# Altium schematic sheet CAN-Sheet.SchDoc
size 420 x 297 mm; SheetNumber: 10; SheetTotal: 15
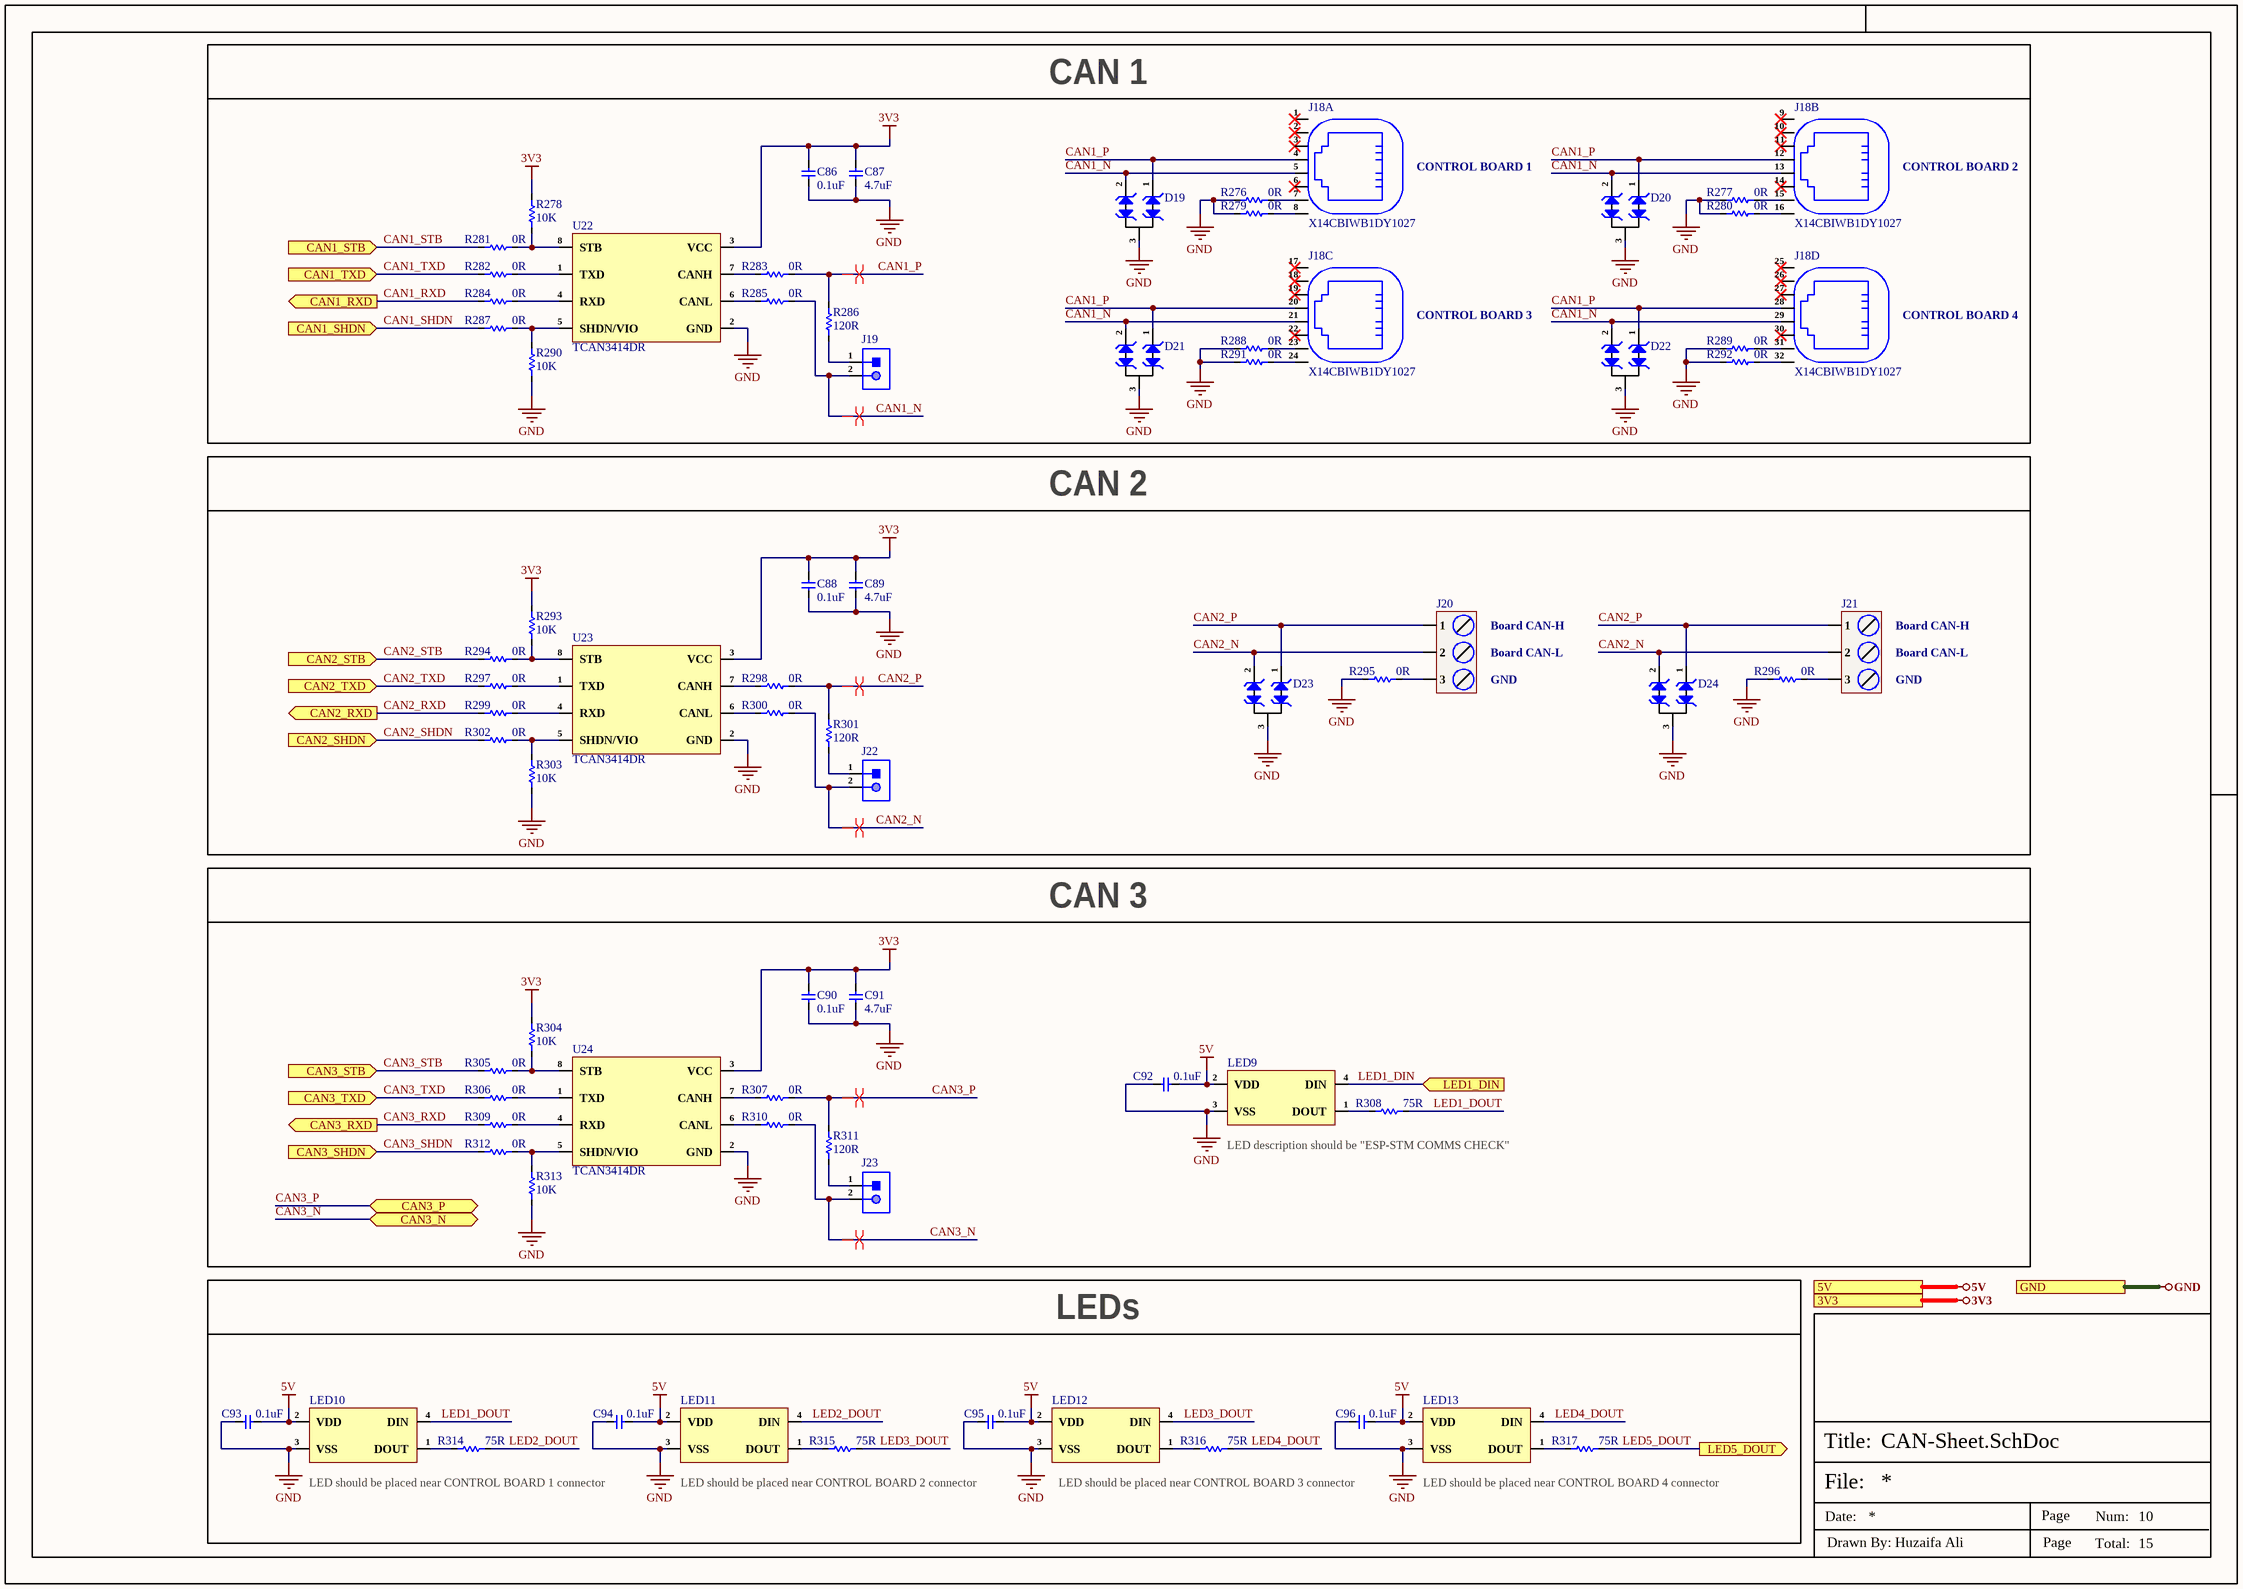
[diagram p0: CAN-Sheet.SchDoc]

## Parts
C86  0.1uF  [Cap-0402]
C87  4.7uF  [Cap-0402]
C88  0.1uF  [Cap-0402]
C89  4.7uF  [Cap-0402]
C90  0.1uF  [Cap-0402]
C91  4.7uF  [Cap-0402]
C92  0.1uF  [Cap-0402]
C93  0.1uF  [Cap-0402]
C94  0.1uF  [Cap-0402]
C95  0.1uF  [Cap-0402]
C96  0.1uF  [Cap-0402]
D19  CDSOT23-T24CAN-Q  [SOT-23]  (value not drawn)
D20  CDSOT23-T24CAN-Q  [SOT-23]  (value not drawn)
D21  CDSOT23-T24CAN-Q  [SOT-23]  (value not drawn)
D22  CDSOT23-T24CAN-Q  [SOT-23]  (value not drawn)
D23  CDSOT23-T24CAN-Q  [SOT-23]  (value not drawn)
D24  CDSOT23-T24CAN-Q  [SOT-23]  (value not drawn)
J18  X14CBIWB1DY1027  [X14CBIWB1DY1027]  (parts A,B,C,D of 4)
J19  X6511WV-02H-C60D30  [HDR1X2_]  (value not drawn)
J20  DB128L-5.08-3P-BK-S  [DB128L-5.08-3P-BK-S]  (value not drawn)
J21  DB128L-5.08-3P-BK-S  [DB128L-5.08-3P-BK-S]  (value not drawn)
J22  X6511WV-02H-C60D30  [HDR1X2_]  (value not drawn)
J23  X6511WV-02H-C60D30  [HDR1X2_]  (value not drawn)
LED9  WS2812D-F5  [WS2812D-F5]  (value not drawn)
LED10  WS2812D-F5  [WS2812D-F5]  (value not drawn)
LED11  WS2812D-F5  [WS2812D-F5]  (value not drawn)
LED12  WS2812D-F5  [WS2812D-F5]  (value not drawn)
LED13  WS2812D-F5  [WS2812D-F5]  (value not drawn)
R276  0R  [Res-0402]
R277  0R  [Res-0402]
R278  10K  [Res-0402]
R279  0R  [Res-0402]
R280  0R  [Res-0402]
R281  0R  [Res-0402]
R282  0R  [Res-0402]
R283  0R  [Res-0402]
R284  0R  [Res-0402]
R285  0R  [Res-0402]
R286  120R  [Res-0603]
R287  0R  [Res-0402]
R288  0R  [Res-0402]
R289  0R  [Res-0402]
R290  10K  [Res-0402]
R291  0R  [Res-0402]
R292  0R  [Res-0402]
R293  10K  [Res-0402]
R294  0R  [Res-0402]
R295  0R  [Res-0402]
R296  0R  [Res-0402]
R297  0R  [Res-0402]
R298  0R  [Res-0402]
R299  0R  [Res-0402]
R300  0R  [Res-0402]
R301  120R  [Res-0603]
R302  0R  [Res-0402]
R303  10K  [Res-0402]
R304  10K  [Res-0402]
R305  0R  [Res-0402]
R306  0R  [Res-0402]
R307  0R  [Res-0402]
R308  75R  [Res-0402]
R309  0R  [Res-0402]
R310  0R  [Res-0402]
R311  120R  [Res-0603]
R312  0R  [Res-0402]
R313  10K  [Res-0402]
R314  75R  [Res-0402]
R315  75R  [Res-0402]
R316  75R  [Res-0402]
R317  75R  [Res-0402]
U22  TCAN3414DR  [SOIC-8(0.154", 3.90mm Width)]
U23  TCAN3414DR  [SOIC-8(0.154", 3.90mm Width)]
U24  TCAN3414DR  [SOIC-8(0.154", 3.90mm Width)]

## Blocks framed on the sheet
CAN 1: C86 C87 D19-D22 J18 J19 R276-R292 U22
CAN 2: C88 C89 D23 D24 J20-J22 R293-R303 U23
CAN 3: C90-C92 J23 LED9 R304-R313 U24
LEDs: C93-C96 LED10-LED13 R314-R317

## Ports
3V3 (see Top-Sheet[2C], Controller-Sheet-1[4D], Controller-Sheet-2[4D], Controller-Sheet-3[4D], DIOs-Lights-Sensors-Sheet[4D], Display-Sheet[5D], ESP32_Sheet[6D], EtherCAT-Sheet[1D], Ethernet-Sheet[5D], Power-Sheet[4D], RS232-Sheet[5D], RS485-Sheet[5D], STM32-USB-Sheet[4D]), 5V (see Top-Sheet[2C], Analog-AIO-Sheet[5D], Controller-Sheet-2[4D], Controller-Sheet-3[4D], DIOs-Lights-Sensors-Sheet[4D], Display-Sheet[5D], Power-Sheet[4D], RS232-Sheet[5D], RS485-Sheet[5D], STM32-USB-Sheet[4D]), CAN1_RXD (out, see Top-Sheet[2C]), CAN1_SHDN (in, see Top-Sheet[2C]), CAN1_STB (in, see Top-Sheet[2C]), CAN1_TXD (in, see Top-Sheet[2C]), CAN2_RXD (out, see Top-Sheet[2D]), CAN2_SHDN (in, see Top-Sheet[2C]), CAN2_STB (in, see Top-Sheet[2D]), CAN2_TXD (in, see Top-Sheet[2D]), CAN3_N (bidir, see Top-Sheet[2C]), CAN3_P (bidir, see Top-Sheet[2C]), CAN3_RXD (out, see Top-Sheet[2D]), CAN3_SHDN (in, see Top-Sheet[2D]), CAN3_STB (in, see Top-Sheet[2D]), CAN3_TXD (in, see Top-Sheet[2D]), GND (see Top-Sheet[2C], Analog-AIO-Sheet[5D], Controller-Sheet-1[4D], Controller-Sheet-2[4D], Controller-Sheet-3[4D], DIOs-Lights-Sensors-Sheet[4D], Display-Sheet[5D], ESP32_Sheet[6D], EtherCAT-Sheet[1D], Ethernet-Sheet[5D], Power-Sheet[4D], RS232-Sheet[5D], RS485-Sheet[5D], STM32-USB-Sheet[4D]), LED1_DIN (in, see Top-Sheet[2D]), LED5_DOUT (out, see Top-Sheet[2D], RS232-Sheet[5B])

## Nets
3V3: C86.2 C87.2 C88.2 C89.2 C90.2 C91.2 R278.2 R293.2 R304.2 U22.3(VCC) U23.3(VCC) U24.3(VCC) ; port 3V3
5V: C92.2 C93.2 C94.2 C95.2 C96.2 LED9.2(VDD) LED10.2(VDD) LED11.2(VDD) LED12.2(VDD) LED13.2(VDD) ; port 5V
GND: C86.1 C87.1 C88.1 C89.1 C90.1 C91.1 C92.1 C93.1 C94.1 C95.1 C96.1 D19.3 D20.3 D21.3 D22.3 D23.3 D24.3 LED9.3(VSS) LED10.3(VSS) LED11.3(VSS) LED12.3(VSS) LED13.3(VSS) R276.1 R277.1 R279.1 R280.1 R288.1 R289.1 R290.1 R291.1 R292.1 R295.1 R296.1 R303.1 R313.1 U22.2(GND) U23.2(GND) U24.2(GND) ; port GND
CAN1_N: D19.2 D20.2 D21.2 D22.2 J18.5 J18.13 J18.21 J18.29 J19.2 R285.2
CAN1_P: D19.1 D20.1 D21.1 D22.1 J18.4 J18.12 J18.20 J18.28 R283.2 R286.2
CAN1_RXD: R284.1 ; port CAN1_RXD
CAN1_SHDN: R287.1 ; port CAN1_SHDN
CAN1_STB: R281.1 ; port CAN1_STB
CAN1_TXD: R282.1 ; port CAN1_TXD
CAN2_N: D23.2 D24.2 J20.2 J21.2 J22.2 R300.2
CAN2_P: D23.1 D24.1 J20.1 J21.1 R298.2 R301.2
CAN2_RXD: R299.1 ; port CAN2_RXD
CAN2_SHDN: R302.1 ; port CAN2_SHDN
CAN2_STB: R294.1 ; port CAN2_STB
CAN2_TXD: R297.1 ; port CAN2_TXD
CAN3_N: J23.2 R310.2 ; port CAN3_N
CAN3_P: R307.2 R311.2 ; port CAN3_P
CAN3_RXD: R309.1 ; port CAN3_RXD
CAN3_SHDN: R312.1 ; port CAN3_SHDN
CAN3_STB: R305.1 ; port CAN3_STB
CAN3_TXD: R306.1 ; port CAN3_TXD
LED1_DIN: LED9.4(DIN) ; port LED1_DIN
LED1_DOUT: LED10.4(DIN) R308.2
LED2_DOUT: LED11.4(DIN) R314.2
LED3_DOUT: LED12.4(DIN) R315.2
LED4_DOUT: LED13.4(DIN) R316.2
LED5_DOUT: R317.2 ; port LED5_DOUT
NetJ18_7: J18.7 R276.2
NetJ18_8: J18.8 R279.2
NetJ18_15: J18.15 R277.2
NetJ18_16: J18.16 R280.2
NetJ18_23: J18.23 R288.2
NetJ18_24: J18.24 R291.2
NetJ18_31: J18.31 R289.2
NetJ18_32: J18.32 R292.2
NetJ19_1: J19.1 R286.1
NetJ20_3: J20.3 R295.2
NetJ21_3: J21.3 R296.2
NetJ22_1: J22.1 R301.1
NetJ23_1: J23.1 R311.1
NetLED9_1: LED9.1(DOUT) R308.1
NetLED10_1: LED10.1(DOUT) R314.1
NetLED11_1: LED11.1(DOUT) R315.1
NetLED12_1: LED12.1(DOUT) R316.1
NetLED13_1: LED13.1(DOUT) R317.1
NetR278_1: R278.1 R281.2 U22.8(STB)
NetR282_2: R282.2 U22.1(TXD)
NetR283_1: R283.1 U22.7(CANH)
NetR284_2: R284.2 U22.4(RXD)
NetR285_1: R285.1 U22.6(CANL)
NetR287_2: R287.2 R290.2 U22.5(SHDN/VIO)
NetR293_1: R293.1 R294.2 U23.8(STB)
NetR297_2: R297.2 U23.1(TXD)
NetR298_1: R298.1 U23.7(CANH)
NetR299_2: R299.2 U23.4(RXD)
NetR300_1: R300.1 U23.6(CANL)
NetR302_2: R302.2 R303.2 U23.5(SHDN/VIO)
NetR304_1: R304.1 R305.2 U24.8(STB)
NetR306_2: R306.2 U24.1(TXD)
NetR307_1: R307.1 U24.7(CANH)
NetR309_2: R309.2 U24.4(RXD)
NetR310_1: R310.1 U24.6(CANL)
NetR312_2: R312.2 R313.2 U24.5(SHDN/VIO)

Not connected (* = marked no-connect by the designer): J18 1* 2* 3* 6* 9* 10* 11* 14* 17* 18* 19* 22* 25* 26* 27* 30*

## Layout directives
differential pair; differential pair class CAN: CAN1_N, CAN1_P, CAN2_N, CAN2_P, CAN3_N, CAN3_P

## Notes on the sheet
- CONTROL BOARD 1
- CONTROL BOARD 2
- CONTROL BOARD 3
- CONTROL BOARD 4
- Board CAN-H
- Board CAN-L
- GND
- LED description should be "ESP-STM COMMS CHECK"
- LED should be placed near CONTROL BOARD 1 connector
- LED should be placed near CONTROL BOARD 2 connector
- LED should be placed near CONTROL BOARD 3 connector
- LED should be placed near CONTROL BOARD 4 connector
- File:
- Title:
- Date:
- Page
- Num:
- Total:
- Drawn By: Huzaifa Ali

## Library data of the parts
C86 C88 C90 C92-C96 = CC0402JRX7R7BB104: CAP CER 0.1UF 16V X7R 0402; Manufacturer: Yageo; Material: 4241ConductorMaterial; Value: 100nF; Tolerance: 5%; Item Type: Capacitor; Supplier: Digikey; Supplier Part Number: 311-1676-1-ND; Manufacturer Part Number: CC0402JRX7R7BB104; RoHS: Yes; Category: Ceramic Capacitors; Stock: 1659111; Pricing: 1=0.1, 10=0.046, 50=0.0262, 100=0.0203, 500=0.01528, 1000=0.012, 2500=0.01091, 5000=0.01004 (USD); Mounting Technology: Surface Mount; Case/Package: 0402; Case Code (Metric): 1005; Case Code (Imperial): 0402; Min Operating Temperature: -55°C; Max Operating Temperature: 125°C; Dielectric: X7R; Packaging: Tape and Reel; Package Quantity: 10000; Voltage Rating (DC): 16V; Voltage Rating: 16V; Series: CC; Construction: Flat; Length: 0.039inch; Width: 0.02inch; Height: 0.5mm; Thickness: 0.022inch; Lead Free: Lead Free; Halogen Free: Halogen Free; RoHS Compliant: Yes; ComponentLink1URL: https://datasheet.ciiva.com/13210/upy-gphc-x7r-6-3v-to-50v-8-12304-13210152.pdf?src-supplier=Mouser; ComponentLink1Description: https://datasheet.ciiva.com/13210/upy-gphc-x7r-6-3v-to-50v-8-12304-13210152.pdf?src-supplier=Mouser; LCSC Part Number: C541464
C87 C89 C91 = CC0402KRX5R6BB475: CAP CER 4.7UF 10V X5R 0402; Manufacturer: Yageo; Tolerance: 10%; Supplier 1: Farnell; Manufacturer Part Number: CC0402KRX5R6BB475; RoHS: Yes; Category: Ceramic Capacitors; Stock 1: 20000; Pricing 1: 10000=0.02310, 50000=0.02100 (GBP); Mount: Surface Mount; Case/Package: 0402; Case Code (Imperial): 0402; Case Code (Metric): 1005; Min Operating Temperature: -55°C; Max Operating Temperature: 85°C; Packaging: Cut Tape; Capacitance: 4.7uF; Voltage Rating: 10V; RoHS Compliant: Yes; ComponentLink1URL: http://www.yageo.com/documents/recent/UPY-GPHC_X5R_4V-to-50V_25.pdf?src-supplier=Digi-Key; ComponentLink1Description: http://www.yageo.com/documents/recent/UPY-GPHC_X5R_4V-to-50V_25.pdf?src-supplier=Digi-Key; Supplier Part Number 1: 3871698; LCSC Part Number: C326586
D19-D24 = CDSOT23-T24CAN-Q: TVS DIODE 24VWM 40VC SOT23-3; Manufacturer: Bourns; Item Type: TVS Diodes; Supplier: Digikey; LCSC Part Number: C350941; Manufacturer Part Number: CDSOT23-T24CAN-Q; RoHS: Yes; Stock: 17231; Pricing: 1=0.36, 10=0.282, 100=0.1691, 500=0.15656, 1000=0.10645, 3000=0.098, 6000=0.09393, 9000=0.08454, 30000=0.08328, 75000=0.07827 (USD); RoHS Compliant: 5897YesNo; ComponentLink1URL: http://www.farnell.com/datasheets/2372435.pdf?src-supplier=Farnell; ComponentLink1Description: http://www.farnell.com/datasheets/2372435.pdf?src-supplier=Farnell; ComponentLink2URL: https://www.bourns.com/docs/Product-Datasheets/cdsot23-t24can-Q.pdf?src-supplier=Digikey; ComponentLink2Description: https://www.bourns.com/docs/Product-Datasheets/cdsot23-t24can-Q.pdf?src-supplier=Digikey; ComponentLink3URL: http://www.farnell.com/datasheets/2372435.pdf?src-supplier=Newark; ComponentLink3Description: http://www.farnell.com/datasheets/2372435.pdf?src-supplier=Newark
J18 = X14CBIWB1DY1027: RJ45Receptacle 4 Unshielded Bend-in Gold Phosphor Bronze Without LED -40℃~+85℃ Plugin Ethernet Connectors / Modular Connectors (RJ45 RJ11) ROHS; Manufacturer: XKB Connection; Manufacturer Part Number: X14CBIWB1DY1027; Package: Plugin; LCSC Part Number: C2931489; Item Type: Connectors (RJ45 RJ11); ComponentLink1Description: LCSC; ComponentLink1URL: https://www.lcsc.com/product-detail/Ethernet-Connectors-Modular-Connectors-RJ45-RJ11_XKB-Connection-X14CBIWB1DY1027_C2931489.html
J19 J22 J23 = X6511WV-02H-C60D30: Gold 250V 3A Straight Square Pins 2.5mm 2P 260℃ 6mm -40℃~+105℃ 3mm 2.54mm Plugin Black Brass 1x2P Plugin,P=2.54mm Pin Headers ROHS; Manufacturer: XKB; Item Type: Male Header; Manufacturer Part Number: X6511WV-02H-C60D30; Package: Plugin,P=2.54mm; LCSC Part Number: C706874; ComponentLink1Description: LCSC; ComponentLink1URL: https://www.lcsc.com/product-detail/Pin-Headers_XKB-Connectivity-X6511WV-02H-C60D30_C706874.html
J20 J21 = DB128L-5.08-3P-BK-S: 1x3P 18A -40℃~+105℃ 250V Black 12~30 Straight pin 5.08mm 2.5 1 3 Plugin,P=5.08mm Screw terminal ROHS; Manufacturer: DIBO; Item Type: Terminal Block; Manufacturer Part Number: DB128L-5.08-3P-BK-S; Package: Plugin,P=5.08mm; LCSC Part Number: C430602; ComponentLink1Description: LCSC; ComponentLink1URL: https://www.lcsc.com/product-detail/Screw-terminal_DIBO-DB128L-5-08-3P-BK-S_C430602.html
LED9-LED13 = WS2812D-F5: Plugin,D=5mm RGB LEDs ROHS; Manufacturer: Worldsemi; Item Type: RGB LED; Manufacturer Part Number: WS2812D-F5; Package: Plugin,D=5mm; LCSC Part Number: C190565; ComponentLink1Description: LCSC; ComponentLink1URL: https://jlcpcb.com/partdetail/Worldsemi-WS2812DF5/C190565
R276 R277 R279-R285 R287-R289 R291 R292 R294-R300 R302 R305-R307 R309 R310 R312 = RC0402FR-070RL: RES 0 OHM JUMPER 1/16W 0402; Manufacturer: Yageo; Item Type: Resistors; Tolerance: 1%; Power Rating: 62.5mW; Voltage Rating: 50V; Temperature Coefficient: 200ppm/°C; Max Power Dissipation: 63mW; Supplier 1: Mouser; Manufacturer Part Number: RC0402FR-070RL; RoHS: Yes; Stock 1: 8556842; Pricing 1: 1=0.10000, 10=0.01400, 50=0.01400, 100=0.00600, 1000=0.00300, 5000=0.00200, 10000=0.00100 (USD); Mount: Surface Mount; Case/Package: 0402; Contact Plating: Tin,Matte; Case Code (Imperial): 0402; Case Code (Metric): 1005; Size Code: 0402; Min Operating Temperature: -55°C; Max Operating Temperature: 155°C; Resistance: 0R; Resistor Type: Thick Film; Packaging: Tape and Reel; Termination: SMD/SMT; Features: Moisture Resistant; Series: RC; Number of Terminations: 2; Length: 1mm; Width: 0.5mm; Height: 0.35mm; Radiation Hardening: No; Lead Free: Lead Free; RoHS Compliant: Yes; ComponentLink1URL: https://datasheet.ciiva.com/8896/pyu-rc0402-51-rohs-l-6-8896149.pdf?src-supplier=Avnet; ComponentLink1Description: https://datasheet.ciiva.com/8896/pyu-rc0402-51-rohs-l-6-8896149.pdf?src-supplier=Avnet; ComponentLink2URL: https://datasheet.ciiva.com/16790/pyu-rc0402-51-rohs-l-6-r-16790444.pdf?src-supplier=Future+Electronics; ComponentLink2Description: https://datasheet.ciiva.com/16790/pyu-rc0402-51-rohs-l-6-r-16790444.pdf?src-supplier=Future+Electronics; Supplier Part Number 1: 603-RC0402FR-070RL; LCSC Part Number: C106231
R278 R290 R293 R303 R304 R313 = RC0402FR-0710KL: RES 10K OHM 1% 1/16W 0402; Manufacturer: Yageo; Resistance: 10kR; Voltage Rating (DC): 50V; Temperature Coefficient: 100ppm/°C; Power Rating: 62.5mW; Max Power Dissipation: 63mW; Item Type: Resistor; Supplier 1: Mouser; Manufacturer Part Number: RC0402FR-0710KL; RoHS: Yes; Category: Chip SMD Resistors; Stock 1: 18648329; Pricing 1: 1=0.10000, 10=0.01400, 50=0.01400, 100=0.00500, 1000=0.00300, 10000=0.00200 (USD); Case/Package: 0402; Number of Pins: 2; Case Code (Imperial): 0402; Case Code (Metric): 1005; Min Operating Temperature: -55°C; Max Operating Temperature: 155°C; Resistor Type: Thick Film; Tolerance: 1%; Packaging: Tape and Reel; Voltage Rating: 50V; Termination: SMD/SMT; Working Voltage: 50V; Number of Terminations: 2; Features: Moisture Resistant; Series: RC; Resistance Tolerance: 1%; Construction: Rectangular; Length: 1mm; Width: 0.5mm; Height: 0.32mm; Depth: 0.5mm; Lead Pitch: 0.2mm; REACH SVHC: No SVHC; Lead Free: Lead Free; RoHS Compliant: Yes; Military Standard: Not; ComponentLink1URL: https://datasheet.ciiva.com/7660/38568-7660787.pdf?src-supplier=Element14; ComponentLink1Description: https://datasheet.ciiva.com/7660/38568-7660787.pdf?src-supplier=Element14; ComponentLink2URL: https://datasheet.ciiva.com/7849/1686128-7849814.pdf?src-supplier=Element14; ComponentLink2Description: https://datasheet.ciiva.com/7849/1686128-7849814.pdf?src-supplier=Element14; ComponentLink3URL: https://datasheet.ciiva.com/7983/1018594-7983486.pdf?src-supplier=Element14; ComponentLink3Description: https://datasheet.ciiva.com/7983/1018594-7983486.pdf?src-supplier=Element14; ComponentLink4URL: https://datasheet.ciiva.com/22747/1018594-22747512.pdf?src-supplier=Element14; ComponentLink4Description: https://datasheet.ciiva.com/22747/1018594-22747512.pdf?src-supplier=Element14; ComponentLink5URL: https://datasheet.ciiva.com/12667/pyu-rc0402-51-rohs-l-6-r-12667067.pdf?src-supplier=Mouser; ComponentLink5Description: https://datasheet.ciiva.com/12667/pyu-rc0402-51-rohs-l-6-r-12667067.pdf?src-supplier=Mouser; ComponentLink6URL: https://datasheet.ciiva.com/7849/1784430-7849813.pdf?src-supplier=Element14; ComponentLink6Description: https://datasheet.ciiva.com/7849/1784430-7849813.pdf?src-supplier=Element14; ComponentLink7URL: https://datasheet.ciiva.com/7849/1784430-7849815.pdf?src-supplier=Element14; ComponentLink7Description: https://datasheet.ciiva.com/7849/1784430-7849815.pdf?src-supplier=Element14; Supplier Part Number 1: 603-RC0402FR-0710KL; LCSC Part Number: C60490
R286 R301 R311 = RC0603FR-07120RL: RES 120 OHM 1% 1/10W 0603; Manufacturer: Yageo; Temperature Coefficient: 100ppm/°C; Voltage Rating (DC): 50V; Power Rating: 100mW; Item Type: Resistor; Supplier 1: Digi-Key; Manufacturer Part Number: RC0603FR-07120RL; RoHS: Yes; Category: Chip SMD Resistors; Stock 1: 839061; Pricing 1: 1=0.10000, 10=0.02400, 100=0.00970, 1000=0.00436, 2500=0.00378 (USD); Case/Package: 0603; Number of Pins: 2; Case Code (Metric): 1608; Case Code (Imperial): 0603; Size Code: 0603; Min Operating Temperature: -55°C; Max Operating Temperature: 155°C; Resistance: 120R; Tolerance: 1%; Resistor Type: Thick Film; Packaging: Tape and Reel; Voltage Rating: 50V; Package Quantity: 1; Number of Terminations: 2; Termination: SMD/SMT; Max Power Dissipation: 100mW; Features: Moisture Resistant; Series: RC; Construction: Rectangular; Resistance Tolerance: 1%; Length: 1.6mm; Width: 0.031inch; Height: 0.022inch; Depth: 0.8mm; REACH SVHC: No SVHC; Lead Free: Lead Free; Military Standard: Not; RoHS Compliant: Yes; ComponentLink1URL: https://datasheet.ciiva.com/2553/pyu-r-int-thick-7-2553512.pdf?src-supplier=Digi-Key; ComponentLink1Description: https://datasheet.ciiva.com/2553/pyu-r-int-thick-7-2553512.pdf?src-supplier=Digi-Key; ComponentLink2URL: https://datasheet.ciiva.com/7746/443971-7746248.pdf?src-supplier=Element14; ComponentLink2Description: https://datasheet.ciiva.com/7746/443971-7746248.pdf?src-supplier=Element14; ComponentLink3URL: https://datasheet.ciiva.com/2553/pyu-r-int-thick-7-2553513.pdf?src-supplier=Digi-Key; ComponentLink3Description: https://datasheet.ciiva.com/2553/pyu-r-int-thick-7-2553513.pdf?src-supplier=Digi-Key; ComponentLink4URL: https://datasheet.ciiva.com/7746/443971-7746249.pdf?src-supplier=Element14; ComponentLink4Description: https://datasheet.ciiva.com/7746/443971-7746249.pdf?src-supplier=Element14; ComponentLink5URL: https://datasheet.ciiva.com/2553/pyu-r-int-thick-7-2553514.pdf?src-supplier=Digi-Key; ComponentLink5Description: https://datasheet.ciiva.com/2553/pyu-r-int-thick-7-2553514.pdf?src-supplier=Digi-Key; ComponentLink6URL: https://datasheet.ciiva.com/46395/443971-46395021.pdf?src-supplier=Element14; ComponentLink6Description: https://datasheet.ciiva.com/46395/443971-46395021.pdf?src-supplier=Element14; Supplier Part Number 1: 311-120HRCT-ND; LCSC Part Number: C114640
R308 R314-R317 = RC0402JR-0775RL: RES 75 OHM 5% 1/16W 0402; Manufacturer: Yageo; Item Type: Resistor; Temperature Coefficient: 100ppm/°C; Power Rating: 62.5mW; Voltage Rating: 50V; Max Power Dissipation: 63mW; Supplier: Digikey; Supplier Part Number: 311-75JRCT-ND; Manufacturer Part Number: RC0402JR-0775RL; RoHS: Yes; Stock: 2993323; Pricing: 1=0.1, 10=0.018, 50=0.0102, 100=0.0083, 500=0.00528, 1000=0.00444, 5000=0.00307 (USD); Case/Package: 0402; Pins: 2; Contact Plating: Tin,Lead; Case Code (Imperial): 0402; Case Code (Metric): 1005; Min Operating Temperature: -55°C; Max Operating Temperature: 155°C; Value: 75R; Tolerance: 5%; Resistor Type: Thick Film; Packaging: Tape and Reel; Termination: SMD/SMT; Voltage Rating (DC): 50V; Features: Moisture Resistant; Series: RC; Number of Terminations: 2; Resistance Tolerance: 5%; Length: 1mm; Width: 0.5mm; Height: 0.35mm; Reach SVHC Compliant: No; Lead Free: Lead Free; RoHS Compliant: Yes; ComponentLink1URL: https://datasheet.ciiva.com/7983/1018594-7983612.pdf?src-supplier=Element14; ComponentLink1Description: https://datasheet.ciiva.com/7983/1018594-7983612.pdf?src-supplier=Element14; ComponentLink2URL: https://datasheet.ciiva.com/17082/pyu-rc0402-51-rohs-l-6-r-17082239.pdf?src-supplier=Future+Electronics; ComponentLink2Description: https://datasheet.ciiva.com/17082/pyu-rc0402-51-rohs-l-6-r-17082239.pdf?src-supplier=Future+Electronics; LCSC Part Number: C137841
U22-U24 = TCAN3414DR: IC TRANSCEIVER HALF 1/1 8SOIC; Manufacturer: Texas Instruments; Supplier: Mouser; LCSC Part Number: C22396693; Manufacturer Part Number: TCAN3414DR; RoHS: No; Item Type: IC; Stock: 201; Pricing: 1=1.55, 10=1.1, 50=1.1, 100=0.895, 1000=0.763, 10000=0.681 (USD); Case/Package: SOIC; Pins: 8; Length: 4.9mm; Width: 3.91mm; Height: 1.75mm; Thickness: 1.58mm